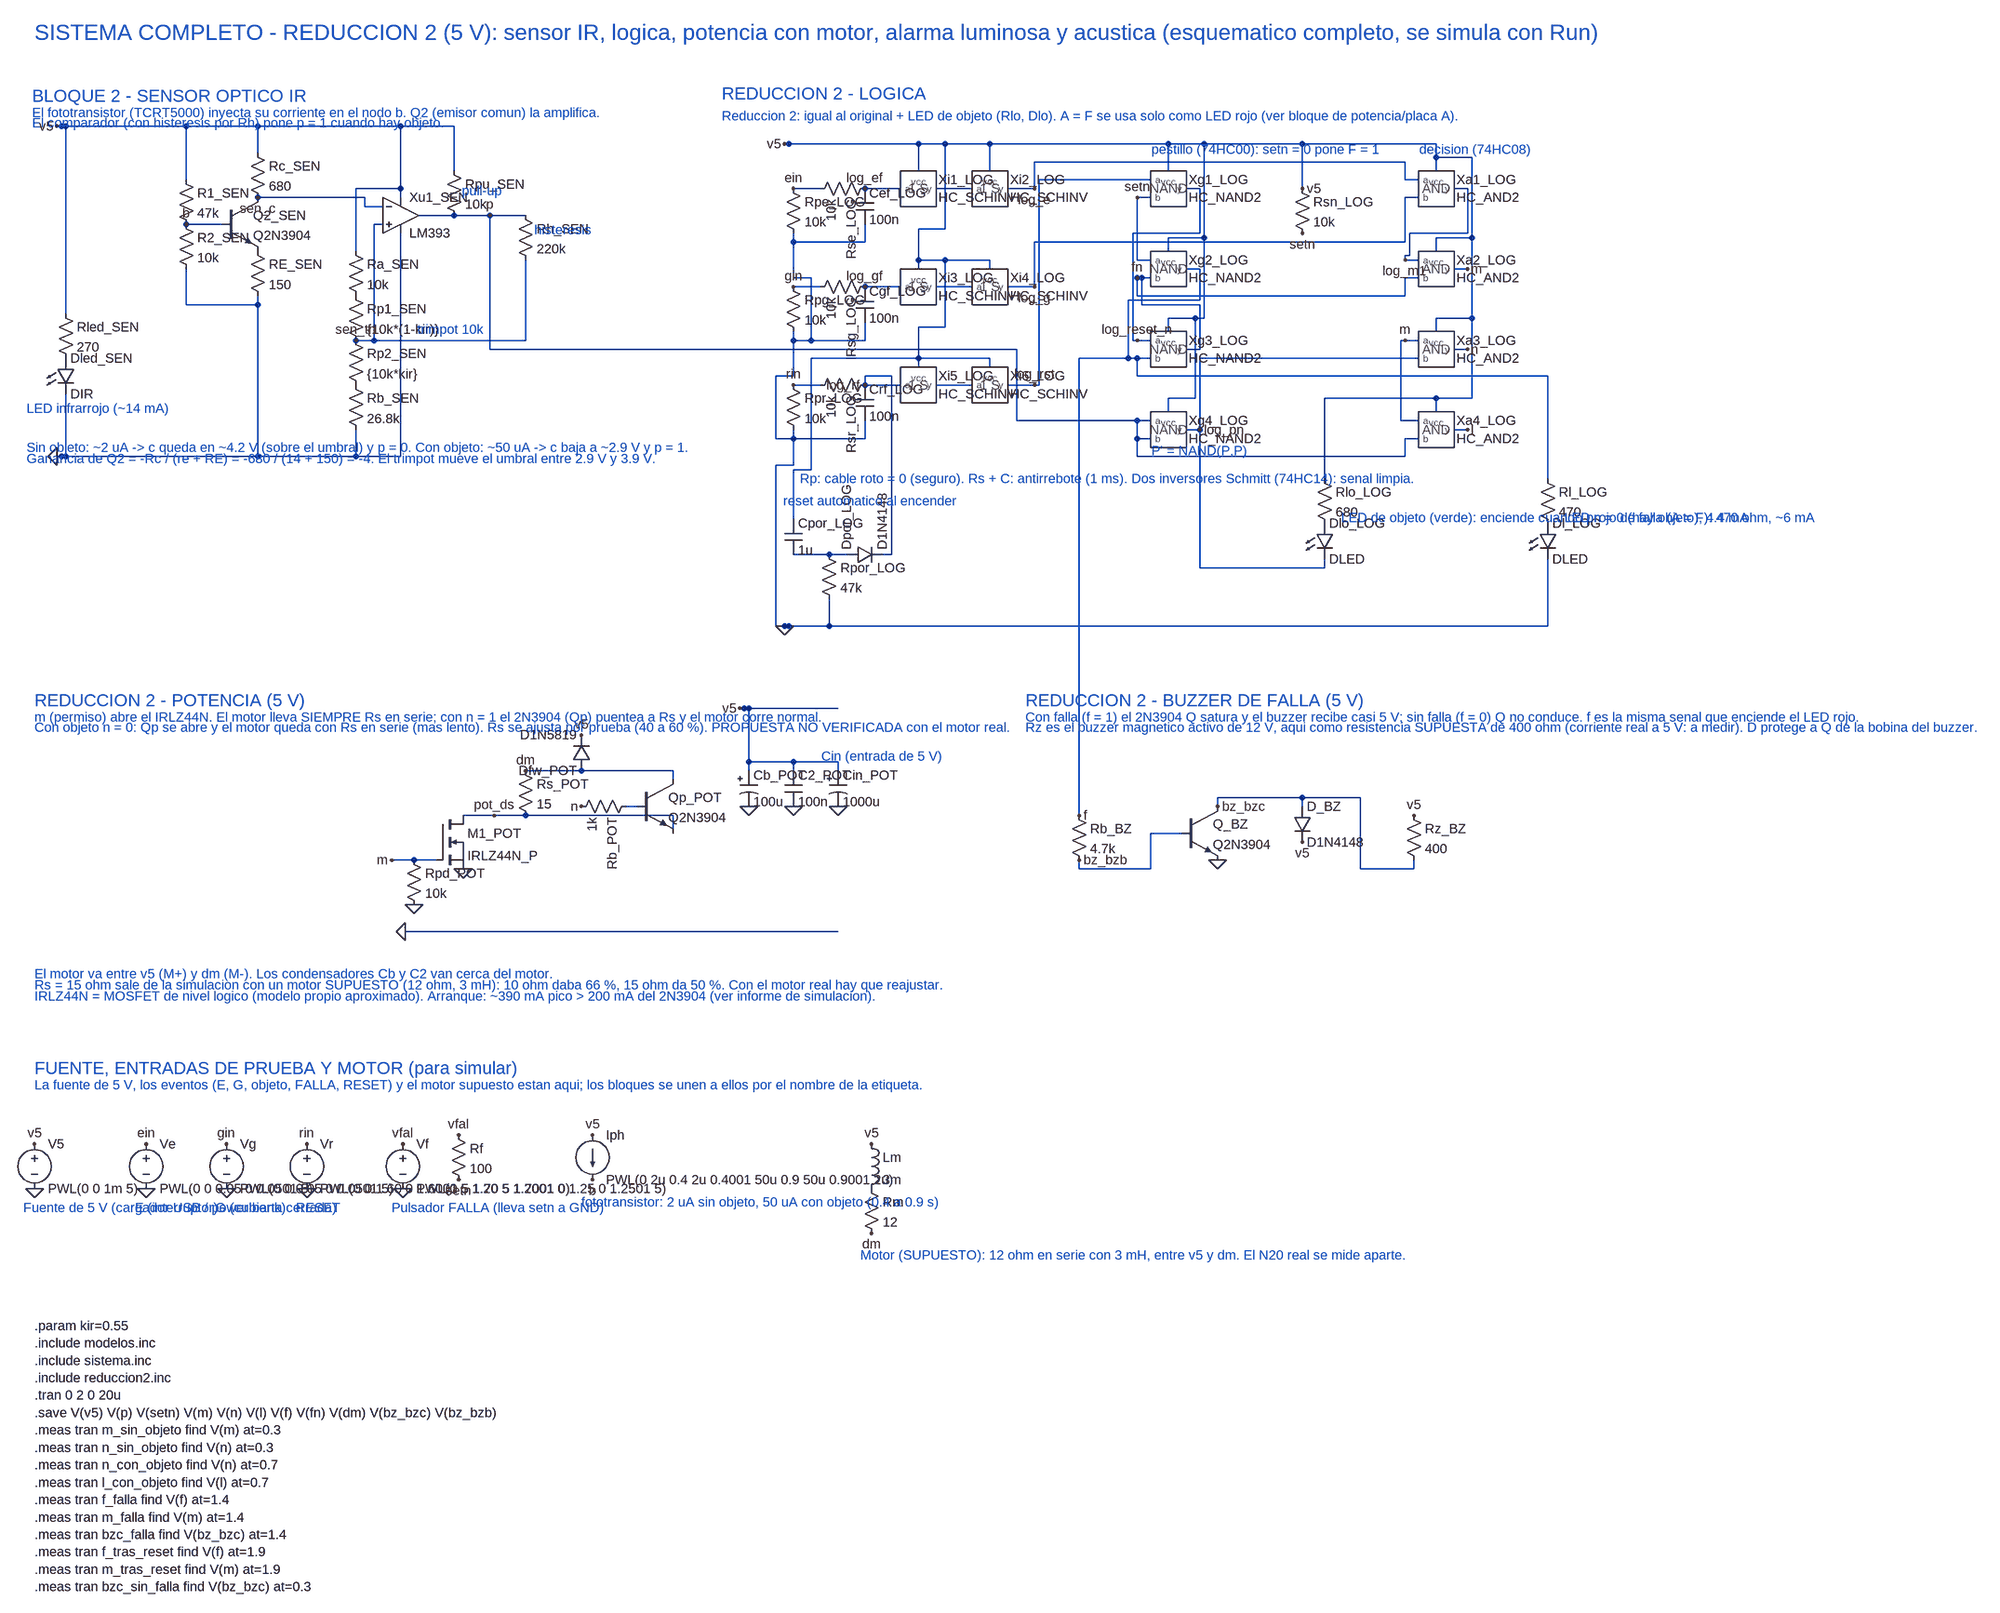
[diagram p0: schematic SISTEMA_COMPLETO_R2.asc]
SISTEMA_COMPLETO_R2.asc, the LTspice schematic file:
Version 4
SHEET 1 9000 2828
WIRE 272 224 336 224
WIRE 400 176 592 176
WIRE 592 176 592 192
WIRE 592 192 624 192
WIRE 576 432 608 432
WIRE 608 432 608 224
WIRE 608 224 624 224
WIRE 688 208 752 208
WIRE 752 208 816 208
WIRE 816 208 880 208
WIRE 880 288 880 432
WIRE 880 432 608 432
WIRE 40 48 752 48
WIRE 40 48 48 48
WIRE 400 96 400 48
WIRE 752 128 752 48
WIRE 272 144 272 48
WIRE 656 176 656 48
WIRE 576 272 576 160
WIRE 576 160 656 160
WIRE 56 384 56 48
WIRE 40 640 656 640
WIRE 40 640 48 640
WIRE 576 592 576 640
WIRE 56 528 56 640
WIRE 400 352 400 640
WIRE 272 304 272 368
WIRE 272 368 400 368
WIRE 656 240 656 640
WIRE 1360 160 1408 160
WIRE 1488 160 1552 160
WIRE 1616 160 1680 160
WIRE 1744 160 1792 160
WIRE 1360 336 1408 336
WIRE 1488 336 1552 336
WIRE 1616 336 1680 336
WIRE 1744 336 1792 336
WIRE 1360 512 1408 512
WIRE 1488 512 1552 512
WIRE 1616 512 1680 512
WIRE 1744 512 1792 512
WIRE 1360 816 1424 816
WIRE 1424 816 1456 816
WIRE 2064 160 2088 160
WIRE 2032 128 2032 104
WIRE 2000 144 1976 144
WIRE 2000 176 1976 176
WIRE 2064 304 2088 304
WIRE 2032 272 2032 248
WIRE 2000 288 1976 288
WIRE 2000 320 1976 320
WIRE 2064 448 2088 448
WIRE 2032 416 2032 392
WIRE 2000 432 1976 432
WIRE 2000 464 1976 464
WIRE 2064 592 2088 592
WIRE 2032 560 2032 536
WIRE 2000 576 1976 576
WIRE 2000 608 1976 608
WIRE 2544 160 2568 160
WIRE 2512 128 2512 104
WIRE 2480 144 2456 144
WIRE 2480 176 2456 176
WIRE 2544 304 2568 304
WIRE 2512 272 2512 248
WIRE 2480 288 2456 288
WIRE 2480 320 2456 320
WIRE 2544 448 2568 448
WIRE 2512 416 2512 392
WIRE 2480 432 2456 432
WIRE 2480 464 2456 464
WIRE 2544 592 2568 592
WIRE 2512 560 2512 536
WIRE 2480 576 2456 576
WIRE 2480 608 2456 608
WIRE 2456 144 2456 112
WIRE 2456 112 1792 112
WIRE 1792 112 1792 160
WIRE 2712 680 2712 496
WIRE 2712 496 1976 496
WIRE 1976 496 1976 464
WIRE 2456 320 2456 352
WIRE 2456 352 1976 352
WIRE 1976 352 1976 320
WIRE 2456 176 2456 256
WIRE 2456 256 1792 256
WIRE 1792 256 1792 336
WIRE 2456 576 2448 576
WIRE 2448 576 2448 432
WIRE 2448 432 2456 432
WIRE 2568 160 2568 240
WIRE 2568 240 2464 240
WIRE 2464 240 2464 280
WIRE 2464 280 2456 280
WIRE 2456 280 2456 288
WIRE 2456 608 2456 640
WIRE 2456 640 1976 640
WIRE 1976 640 1976 608
WIRE 2088 160 2088 240
WIRE 2088 240 1968 240
WIRE 1968 240 1968 432
WIRE 1968 432 1976 432
WIRE 1520 816 1536 816
WIRE 1536 816 1536 496
WIRE 1536 496 1488 496
WIRE 1488 496 1488 512
WIRE 1976 144 1800 144
WIRE 1800 144 1800 512
WIRE 1800 512 1792 512
WIRE 1976 288 1976 176
WIRE 2312 824 2312 840
WIRE 2312 840 2088 840
WIRE 2088 840 2088 592
WIRE 2456 464 2088 464
WIRE 2088 464 2088 592
WIRE 1344 80 2512 80
WIRE 1344 80 1352 80
WIRE 2032 104 2032 80
WIRE 2512 104 2512 80
WIRE 1584 128 1584 80
WIRE 1712 128 1712 80
WIRE 2272 160 2272 80
WIRE 2032 248 2096 248
WIRE 2096 248 2096 80
WIRE 2512 248 2576 248
WIRE 2576 248 2576 104
WIRE 2576 104 2512 104
WIRE 2032 392 2096 392
WIRE 2096 392 2096 248
WIRE 2512 392 2576 392
WIRE 2576 392 2576 248
WIRE 2032 536 2080 536
WIRE 2080 536 2080 392
WIRE 2512 536 2576 536
WIRE 2576 536 2576 392
WIRE 1584 304 1584 232
WIRE 1584 232 1632 232
WIRE 1632 232 1632 80
WIRE 1712 304 1712 288
WIRE 1712 288 1584 288
WIRE 1584 480 1584 408
WIRE 1584 408 1632 408
WIRE 1632 408 1632 288
WIRE 1712 480 1712 464
WIRE 1712 464 1584 464
WIRE 2312 680 2312 536
WIRE 2312 536 2512 536
WIRE 1360 752 1360 664
WIRE 1360 664 1392 664
WIRE 1392 664 1392 464
WIRE 1392 464 1584 464
WIRE 1344 944 2712 944
WIRE 1344 944 1352 944
WIRE 1424 896 1424 944
WIRE 2712 824 2712 944
WIRE 1360 592 1360 656
WIRE 1360 656 1328 656
WIRE 1328 656 1328 944
WIRE 1328 944 1344 944
WIRE 1488 576 1488 608
WIRE 1488 608 1360 608
WIRE 1360 416 1360 496
WIRE 1360 496 1328 496
WIRE 1328 496 1328 608
WIRE 1328 608 1360 608
WIRE 1488 400 1488 432
WIRE 1488 432 1360 432
WIRE 1360 240 1360 320
WIRE 1360 320 1392 320
WIRE 1392 320 1392 432
WIRE 1488 224 1488 256
WIRE 1488 256 1360 256
WIRE 720 1520 640 1520
WIRE 768 1440 880 1440
WIRE 880 1440 1144 1440
WIRE 880 1360 980 1360
WIRE 980 1360 1144 1360
WIRE 1144 1360 1144 1376
WIRE 1144 1472 1144 1440
WIRE 1060 1424 1080 1424
WIRE 1264 1248 1440 1248
WIRE 1264 1248 1272 1248
WIRE 1280 1360 1280 1248
WIRE 1360 1360 1360 1344
WIRE 1360 1344 1280 1344
WIRE 1440 1360 1440 1344
WIRE 1440 1344 1360 1344
WIRE 664 1648 1440 1648
WIRE 2056 1472 2000 1472
WIRE 2000 1472 2000 1536
WIRE 2000 1536 1872 1536
WIRE 1872 1536 1872 1520
WIRE 2088 448 2088 368
WIRE 2088 368 1984 368
WIRE 1984 368 1984 320
WIRE 1984 320 1976 320
WIRE 2272 1424 2272 1408
WIRE 2272 1408 2120 1408
WIRE 2120 1408 2120 1424
WIRE 2472 1520 2472 1536
WIRE 2472 1536 2376 1536
WIRE 2376 1536 2376 1408
WIRE 2376 1408 2272 1408
WIRE 1976 464 1872 464
WIRE 1872 464 1872 1440
WIRE 2088 304 2088 360
WIRE 2088 360 1960 360
WIRE 1960 360 1960 464
WIRE 1976 576 1760 576
WIRE 1760 576 1760 448
WIRE 1760 448 816 448
WIRE 816 448 816 208
WIRE 1976 608 1976 576
FLAG 272 224 b
FLAG 400 176 sen_c
FLAG 576 432 sen_th
FLAG 816 208 p
FLAG 40 48 v5
FLAG 40 640 0
FLAG 1360 160 ein
FLAG 1488 160 log_ef
FLAG 1792 160 log_e
FLAG 1360 336 gin
FLAG 1488 336 log_gf
FLAG 1792 336 log_g
FLAG 1360 512 rin
FLAG 1488 512 log_rf
FLAG 1792 512 log_rst
FLAG 1976 176 setn
FLAG 1976 320 fn
FLAG 1976 432 log_reset_n
FLAG 2088 592 log_pn
FLAG 2272 160 v5
FLAG 2272 240 setn
FLAG 2568 304 m
FLAG 2456 288 log_m1
FLAG 2568 448 n
FLAG 2456 432 m
FLAG 2568 592 l
FLAG 1344 80 v5
FLAG 1344 944 0
FLAG 640 1520 m
FLAG 680 1600 0
FLAG 768 1536 0
FLAG 824 1440 pot_ds
FLAG 880 1360 dm
FLAG 980 1296 v5
FLAG 980 1424 n
FLAG 1280 1424 0
FLAG 1440 1424 0
FLAG 1360 1424 0
FLAG 1264 1248 v5
FLAG 664 1648 0
FLAG 1872 1440 f
FLAG 1872 1520 bz_bzb
FLAG 2120 1424 bz_bzc
FLAG 2120 1520 0
FLAG 2272 1488 v5
FLAG 2472 1440 v5
FLAG 0 2144 v5
FLAG 0 2224 0
FLAG 200 2144 ein
FLAG 200 2224 0
FLAG 344 2144 gin
FLAG 344 2224 0
FLAG 488 2144 rin
FLAG 488 2224 0
FLAG 660 2144 vfal
FLAG 760 2128 vfal
FLAG 760 2208 setn
FLAG 660 2224 0
FLAG 1000 2128 v5
FLAG 1000 2208 b
FLAG 1500 2144 v5
FLAG 1500 2304 dm
SYMBOL res 40 368 R0
SYMATTR InstName Rled_SEN
SYMATTR Value 270
SYMBOL LED 40 464 R0
SYMATTR InstName Dled_SEN
SYMATTR Value DIR
SYMBOL res 256 128 R0
SYMATTR InstName R1_SEN
SYMATTR Value 47k
SYMBOL res 256 208 R0
SYMATTR InstName R2_SEN
SYMATTR Value 10k
SYMBOL npn 336 176 R0
SYMATTR InstName Q2_SEN
SYMATTR Value Q2N3904
SYMBOL res 384 80 R0
SYMATTR InstName Rc_SEN
SYMATTR Value 680
SYMBOL res 384 256 R0
SYMATTR InstName RE_SEN
SYMATTR Value 150
SYMBOL res 560 256 R0
SYMATTR InstName Ra_SEN
SYMATTR Value 10k
SYMBOL res 560 336 R0
SYMATTR InstName Rp1_SEN
SYMATTR Value {10k*(1-kir)}
SYMBOL res 560 416 R0
SYMATTR InstName Rp2_SEN
SYMATTR Value {10k*kir}
SYMBOL res 560 496 R0
SYMATTR InstName Rb_SEN
SYMATTR Value 26.8k
SYMBOL OpAmps\opamp2 656 144 R0
SYMATTR InstName Xu1_SEN
SYMATTR Value LM393
SYMBOL res 736 112 R0
SYMATTR InstName Rpu_SEN
SYMATTR Value 10k
SYMBOL res 864 192 R0
SYMATTR InstName Rh_SEN
SYMATTR Value 220k
SYMBOL res 1344 144 R0
SYMATTR InstName Rpe_LOG
SYMATTR Value 10k
SYMBOL res 1504 144 R90
SYMATTR InstName Rse_LOG
SYMATTR Value 10k
SYMBOL cap 1472 160 R0
SYMATTR InstName Cef_LOG
SYMATTR Value 100n
SYMBOL HC_SCHINV 1584 160 R0
SYMATTR InstName Xi1_LOG
SYMATTR Value HC_SCHINV
SYMBOL HC_SCHINV 1712 160 R0
SYMATTR InstName Xi2_LOG
SYMATTR Value HC_SCHINV
SYMBOL res 1344 320 R0
SYMATTR InstName Rpg_LOG
SYMATTR Value 10k
SYMBOL res 1504 320 R90
SYMATTR InstName Rsg_LOG
SYMATTR Value 10k
SYMBOL cap 1472 336 R0
SYMATTR InstName Cgf_LOG
SYMATTR Value 100n
SYMBOL HC_SCHINV 1584 336 R0
SYMATTR InstName Xi3_LOG
SYMATTR Value HC_SCHINV
SYMBOL HC_SCHINV 1712 336 R0
SYMATTR InstName Xi4_LOG
SYMATTR Value HC_SCHINV
SYMBOL res 1344 496 R0
SYMATTR InstName Rpr_LOG
SYMATTR Value 10k
SYMBOL res 1504 496 R90
SYMATTR InstName Rsr_LOG
SYMATTR Value 10k
SYMBOL cap 1472 512 R0
SYMATTR InstName Crf_LOG
SYMATTR Value 100n
SYMBOL HC_SCHINV 1584 512 R0
SYMATTR InstName Xi5_LOG
SYMATTR Value HC_SCHINV
SYMBOL HC_SCHINV 1712 512 R0
SYMATTR InstName Xi6_LOG
SYMATTR Value HC_SCHINV
SYMBOL cap 1344 752 R0
SYMATTR InstName Cpor_LOG
SYMATTR Value 1u
SYMBOL res 1408 800 R0
SYMATTR InstName Rpor_LOG
SYMATTR Value 47k
SYMBOL diode 1456 832 R270
SYMATTR InstName Dpor_LOG
SYMATTR Value D1N4148
SYMBOL HC_NAND2 2032 160 R0
SYMATTR InstName Xg1_LOG
SYMATTR Value HC_NAND2
SYMBOL HC_NAND2 2032 304 R0
SYMATTR InstName Xg2_LOG
SYMATTR Value HC_NAND2
SYMBOL HC_NAND2 2032 448 R0
SYMATTR InstName Xg3_LOG
SYMATTR Value HC_NAND2
SYMBOL HC_NAND2 2032 592 R0
SYMATTR InstName Xg4_LOG
SYMATTR Value HC_NAND2
SYMBOL res 2256 144 R0
SYMATTR InstName Rsn_LOG
SYMATTR Value 10k
SYMBOL HC_AND2 2512 160 R0
SYMATTR InstName Xa1_LOG
SYMATTR Value HC_AND2
SYMBOL HC_AND2 2512 304 R0
SYMATTR InstName Xa2_LOG
SYMATTR Value HC_AND2
SYMBOL HC_AND2 2512 448 R0
SYMATTR InstName Xa3_LOG
SYMATTR Value HC_AND2
SYMBOL HC_AND2 2512 592 R0
SYMATTR InstName Xa4_LOG
SYMATTR Value HC_AND2
SYMBOL res 2296 664 R0
SYMATTR InstName Rlo_LOG
SYMATTR Value 680
SYMBOL LED 2296 760 R0
SYMATTR InstName Dlo_LOG
SYMATTR Value DLED
SYMBOL res 2696 664 R0
SYMATTR InstName Rl_LOG
SYMATTR Value 470
SYMBOL LED 2696 760 R0
SYMATTR InstName Dl_LOG
SYMATTR Value DLED
SYMBOL res 664 1504 R0
SYMATTR InstName Rpd_POT
SYMATTR Value 10k
SYMBOL nmos 720 1440 R0
SYMATTR InstName M1_POT
SYMATTR Value IRLZ44N_P
SYMBOL res 864 1344 R0
SYMATTR InstName Rs_POT
SYMATTR Value 15
SYMBOL diode 996 1360 R180
SYMATTR InstName Dfw_POT
SYMATTR Value D1N5819
SYMBOL npn 1080 1376 R0
SYMATTR InstName Qp_POT
SYMATTR Value Q2N3904
SYMBOL res 1076 1408 R90
SYMATTR InstName Rb_POT
SYMATTR Value 1k
SYMBOL polcap 1264 1360 R0
SYMATTR InstName Cb_POT
SYMATTR Value 100u
SYMBOL polcap 1424 1360 R0
SYMATTR InstName Cin_POT
SYMATTR Value 1000u
SYMBOL cap 1344 1360 R0
SYMATTR InstName C2_POT
SYMATTR Value 100n
SYMBOL res 1856 1424 R0
SYMATTR InstName Rb_BZ
SYMATTR Value 4.7k
SYMBOL npn 2056 1424 R0
SYMATTR InstName Q_BZ
SYMATTR Value Q2N3904
SYMBOL diode 2256 1424 R0
SYMATTR InstName D_BZ
SYMATTR Value D1N4148
SYMBOL res 2456 1424 R0
SYMATTR InstName Rz_BZ
SYMATTR Value 400
SYMBOL voltage 0 2128 R0
SYMATTR InstName V5
SYMATTR Value PWL(0 0 1m 5)
SYMBOL voltage 200 2128 R0
SYMATTR InstName Ve
SYMATTR Value PWL(0 0 0.05 0 0.0501 5)
SYMBOL voltage 344 2128 R0
SYMATTR InstName Vg
SYMATTR Value PWL(0 0 0.05 0 0.0501 5)
SYMBOL voltage 488 2128 R0
SYMATTR InstName Vr
SYMATTR Value PWL(0 0 1.60 0 1.6001 5 1.70 5 1.7001 0)
SYMBOL voltage 660 2128 R0
SYMATTR InstName Vf
SYMATTR Value PWL(0 5 1.20 5 1.2001 0 1.25 0 1.2501 5)
SYMBOL res 744 2112 R0
SYMATTR InstName Rf
SYMATTR Value 100
SYMBOL current 1000 2128 R0
SYMATTR InstName Iph
SYMATTR Value PWL(0 2u 0.4 2u 0.4001 50u 0.9 50u 0.9001 2u)
SYMBOL ind 1484 2128 R0
SYMATTR InstName Lm
SYMATTR Value 3m
SYMBOL res 1484 2208 R0
SYMATTR InstName Rm
SYMATTR Value 12
TEXT -4 -6 Left 3 ;BLOQUE 2 - SENSOR OPTICO IR
TEXT -4 24 Left 2 ;El fototransistor (TCRT5000) inyecta su corriente en el nodo b. Q2 (emisor comun) la amplifica.
TEXT -4 42 Left 2 ;El comparador (con histeresis por Rh) pone p = 1 cuando hay objeto.
TEXT -14 554 Left 2 ;LED infrarrojo (~14 mA)
TEXT 686 412 Left 2 ;trimpot 10k
TEXT 896 234 Left 2 ;histeresis
TEXT 766 164 Left 2 ;pull-up
TEXT -14 624 Left 2 ;Sin objeto: ~2 uA -> c queda en ~4.2 V (sobre el umbral) y p = 0. Con objeto: ~50 uA -> c baja a ~2.9 V y p = 1.
TEXT -14 644 Left 2 ;Ganancia de Q2 = -Rc / (re + RE) = -680 / (14 + 150) = -4. El trimpot mueve el umbral entre 2.9 V y 3.9 V.
TEXT 1372 680 Left 2 ;Rp: cable roto = 0 (seguro). Rs + C: antirrebote (1 ms). Dos inversores Schmitt (74HC14): senal limpia.
TEXT 1342 720 Left 2 ;reset automatico al encender
TEXT 2002 90 Left 2 ;pestillo (74HC00): setn = 0 pone F = 1
TEXT 2002 630 Left 2 ;P' = NAND(P,P)
TEXT 2482 90 Left 2 ;decision (74HC08)
TEXT 2742 750 Left 2 ;LED rojo de falla (A = F): 470 ohm, ~6 mA
TEXT 2342 750 Left 2 ;LED de objeto (verde): enciende cuando pn = 0 (hay objeto), 4.4 mA
TEXT 1232 -10 Left 3 ;REDUCCION 2 - LOGICA
TEXT 1232 30 Left 2 ;Reduccion 2: igual al original + LED de objeto (Rlo, Dlo). A = F se usa solo como LED rojo (ver bloque de potencia/placa A).
TEXT 0 1234 Left 3 ;REDUCCION 2 - POTENCIA (5 V)
TEXT 0 1264 Left 2 ;m (permiso) abre el IRLZ44N. El motor lleva SIEMPRE Rs en serie; con n = 1 el 2N3904 (Qp) puentea a Rs y el motor corre normal.
TEXT 0 1282 Left 2 ;Con objeto n = 0: Qp se abre y el motor queda con Rs en serie (mas lento). Rs se ajusta por prueba (40 a 60 %). PROPUESTA NO VERIFICADA con el motor real.
TEXT 1410 1334 Left 2 ;Cin (entrada de 5 V)
TEXT 0 1724 Left 2 ;El motor va entre v5 (M+) y dm (M-). Los condensadores Cb y C2 van cerca del motor.
TEXT 0 1744 Left 2 ;Rs = 15 ohm sale de la simulacion con un motor SUPUESTO (12 ohm, 3 mH): 10 ohm daba 66 %, 15 ohm da 50 %. Con el motor real hay que reajustar.
TEXT 0 1764 Left 2 ;IRLZ44N = MOSFET de nivel logico (modelo propio aproximado). Arranque: ~390 mA pico > 200 mA del 2N3904 (ver informe de simulacion).
TEXT 1776 1234 Left 3 ;REDUCCION 2 - BUZZER DE FALLA (5 V)
TEXT 1776 1264 Left 2 ;Con falla (f = 1) el 2N3904 Q satura y el buzzer recibe casi 5 V; sin falla (f = 0) Q no conduce. f es la misma senal que enciende el LED rojo.
TEXT 1776 1282 Left 2 ;Rz es el buzzer magnetico activo de 12 V, aqui como resistencia SUPUESTA de 400 ohm (corriente real a 5 V: a medir). D protege a Q de la bobina del buzzer.
TEXT 0 2008 Left 3 ;FUENTE, ENTRADAS DE PRUEBA Y MOTOR (para simular)
TEXT 0 2038 Left 2 ;La fuente de 5 V, los eventos (E, G, objeto, FALLA, RESET) y el motor supuesto estan aqui; los bloques se unen a ellos por el nombre de la etiqueta.
TEXT -20 2258 Left 2 ;Fuente de 5 V (cargador USB / power bank)
TEXT 180 2258 Left 2 ;E (interruptor)
TEXT 324 2258 Left 2 ;G (cubierta cerrada)
TEXT 468 2258 Left 2 ;RESET
TEXT 640 2258 Left 2 ;Pulsador FALLA (lleva setn a GND)
TEXT 980 2248 Left 2 ;fototransistor: 2 uA sin objeto, 50 uA con objeto (0.4 a 0.9 s)
TEXT 1480 2343 Left 2 ;Motor (SUPUESTO): 12 ohm en serie con 3 mH, entre v5 y dm. El N20 real se mide aparte.
TEXT 0 -120 Left 4 ;SISTEMA COMPLETO - REDUCCION 2 (5 V): sensor IR, logica, potencia con motor, alarma luminosa y acustica (esquematico completo, se simula con Run)
TEXT 0 2528 Left 2 !.param kir=0.55\n.include modelos.inc\n.include sistema.inc\n.include reduccion2.inc\n.tran 0 2 0 20u\n.save V(v5) V(p) V(setn) V(m) V(n) V(l) V(f) V(fn) V(dm) V(bz_bzc) V(bz_bzb)\n.meas tran m_sin_objeto find V(m) at=0.3\n.meas tran n_sin_objeto find V(n) at=0.3\n.meas tran n_con_objeto find V(n) at=0.7\n.meas tran l_con_objeto find V(l) at=0.7\n.meas tran f_falla find V(f) at=1.4\n.meas tran m_falla find V(m) at=1.4\n.meas tran bzc_falla find V(bz_bzc) at=1.4\n.meas tran f_tras_reset find V(f) at=1.9\n.meas tran m_tras_reset find V(m) at=1.9\n.meas tran bzc_sin_falla find V(bz_bzc) at=0.3

The netlist it stands for:
* SISTEMA_COMPLETO_R2.asc
Rled_SEN v5 P001 270
Dled_SEN P001 0 DIR
R1_SEN v5 b 47k
R2_SEN b 0 10k
Q2_SEN sen_c b P002 0 Q2N3904
Rc_SEN v5 sen_c 680
RE_SEN P002 0 150
Ra_SEN v5 P003 10k
Rp1_SEN P003 sen_th {10k*(1-kir)}
Rp2_SEN sen_th P004 {10k*kir}
Rb_SEN P004 0 26.8k
XXu1_SEN sen_th sen_c v5 0 p LM393  ; pins In+ In- V+ V- OUT
Rpu_SEN v5 p 10k
Rh_SEN p sen_th 220k
Rpe_LOG ein 0 10k
Rse_LOG log_ef ein 10k
Cef_LOG log_ef 0 100n
XXi1_LOG log_ef N001 v5 HC_SCHINV  ; pins a y vcc
XXi2_LOG N001 log_e v5 HC_SCHINV  ; pins a y vcc
Rpg_LOG gin 0 10k
Rsg_LOG log_gf gin 10k
Cgf_LOG log_gf 0 100n
XXi3_LOG log_gf N002 v5 HC_SCHINV  ; pins a y vcc
XXi4_LOG N002 log_g v5 HC_SCHINV  ; pins a y vcc
Rpr_LOG rin 0 10k
Rsr_LOG log_rf rin 10k
Crf_LOG log_rf 0 100n
XXi5_LOG log_rf N003 v5 HC_SCHINV  ; pins a y vcc
XXi6_LOG N003 log_rst v5 HC_SCHINV  ; pins a y vcc
Cpor_LOG v5 N004 1u
Rpor_LOG N004 0 47k
Dpor_LOG N004 log_rf D1N4148
XXg1_LOG log_rst setn log_reset_n v5 HC_NAND2  ; pins a b y vcc
XXg2_LOG setn fn f v5 HC_NAND2  ; pins a b y vcc
XXg3_LOG log_reset_n f fn v5 HC_NAND2  ; pins a b y vcc
XXg4_LOG p p log_pn v5 HC_NAND2  ; pins a b y vcc
Rsn_LOG v5 setn 10k
XXa1_LOG log_e log_g log_m1 v5 HC_AND2  ; pins a b y vcc
XXa2_LOG log_m1 fn m v5 HC_AND2  ; pins a b y vcc
XXa3_LOG m log_pn n v5 HC_AND2  ; pins a b y vcc
XXa4_LOG m p l v5 HC_AND2  ; pins a b y vcc
Rlo_LOG v5 P005 680
Dlo_LOG P005 log_pn DLED
Rl_LOG f P006 470
Dl_LOG P006 0 DLED
Rpd_POT m 0 10k
M1_POT pot_ds m 0 0 IRLZ44N_P
Rs_POT dm pot_ds 15
Dfw_POT dm v5 D1N5819
Qp_POT dm N005 pot_ds 0 Q2N3904
Rb_POT N005 n 1k
Cb_POT v5 0 100u
Cin_POT v5 0 1000u
C2_POT v5 0 100n
Rb_BZ f bz_bzb 4.7k
Q_BZ bz_bzc bz_bzb 0 0 Q2N3904
D_BZ bz_bzc v5 D1N4148
Rz_BZ v5 bz_bzc 400
V5 v5 0 PWL(0 0 1m 5)
Ve ein 0 PWL(0 0 0.05 0 0.0501 5)
Vg gin 0 PWL(0 0 0.05 0 0.0501 5)
Vr rin 0 PWL(0 0 1.60 0 1.6001 5 1.70 5 1.7001 0)
Vf vfal 0 PWL(0 5 1.20 5 1.2001 0 1.25 0 1.2501 5)
Rf vfal setn 100
Iph v5 b PWL(0 2u 0.4 2u 0.4001 50u 0.9 50u 0.9001 2u)
Lm v5 P007 3m
Rm P007 dm 12
.model D D
.lib standard.dio
.model NPN NPN
.model PNP PNP
.lib standard.bjt
.model NMOS NMOS
.model PMOS PMOS
.lib standard.mos
* BLOQUE 2 - SENSOR OPTICO IR
* El fototransistor (TCRT5000) inyecta su corriente en el nodo b. Q2 (emisor comun) la amplifica.
* El comparador (con histeresis por Rh) pone p = 1 cuando hay objeto.
* LED infrarrojo (~14 mA)
* trimpot 10k
* histeresis
* pull-up
* Sin objeto: ~2 uA -> c queda en ~4.2 V (sobre el umbral) y p = 0. Con objeto: ~50 uA -> c baja a ~2.9 V y p = 1.
* Ganancia de Q2 = -Rc / (re + RE) = -680 / (14 + 150) = -4. El trimpot mueve el umbral entre 2.9 V y 3.9 V.
* Rp: cable roto = 0 (seguro). Rs + C: antirrebote (1 ms). Dos inversores Schmitt (74HC14): senal limpia.
* reset automatico al encender
* pestillo (74HC00): setn = 0 pone F = 1
* P' = NAND(P,P)
* decision (74HC08)
* LED rojo de falla (A = F): 470 ohm, ~6 mA
* LED de objeto (verde): enciende cuando pn = 0 (hay objeto), 4.4 mA
* REDUCCION 2 - LOGICA
* Reduccion 2: igual al original + LED de objeto (Rlo, Dlo). A = F se usa solo como LED rojo (ver bloque de potencia/placa A).
* REDUCCION 2 - POTENCIA (5 V)
* m (permiso) abre el IRLZ44N. El motor lleva SIEMPRE Rs en serie; con n = 1 el 2N3904 (Qp) puentea a Rs y el motor corre normal.
* Con objeto n = 0: Qp se abre y el motor queda con Rs en serie (mas lento). Rs se ajusta por prueba (40 a 60 %). PROPUESTA NO VERIFICADA con el motor real.
* Cin (entrada de 5 V)
* El motor va entre v5 (M+) y dm (M-). Los condensadores Cb y C2 van cerca del motor.
* Rs = 15 ohm sale de la simulacion con un motor SUPUESTO (12 ohm, 3 mH): 10 ohm daba 66 %, 15 ohm da 50 %. Con el motor real hay que reajustar.
* IRLZ44N = MOSFET de nivel logico (modelo propio aproximado). Arranque: ~390 mA pico > 200 mA del 2N3904 (ver informe de simulacion).
* REDUCCION 2 - BUZZER DE FALLA (5 V)
* Con falla (f = 1) el 2N3904 Q satura y el buzzer recibe casi 5 V; sin falla (f = 0) Q no conduce. f es la misma senal que enciende el LED rojo.
* Rz es el buzzer magnetico activo de 12 V, aqui como resistencia SUPUESTA de 400 ohm (corriente real a 5 V: a medir). D protege a Q de la bobina del buzzer.
* FUENTE, ENTRADAS DE PRUEBA Y MOTOR (para simular)
* La fuente de 5 V, los eventos (E, G, objeto, FALLA, RESET) y el motor supuesto estan aqui; los bloques se unen a ellos por el nombre de la etiqueta.
* Fuente de 5 V (cargador USB / power bank)
* E (interruptor)
* G (cubierta cerrada)
* RESET
* Pulsador FALLA (lleva setn a GND)
* fototransistor: 2 uA sin objeto, 50 uA con objeto (0.4 a 0.9 s)
* Motor (SUPUESTO): 12 ohm en serie con 3 mH, entre v5 y dm. El N20 real se mide aparte.
* SISTEMA COMPLETO - REDUCCION 2 (5 V): sensor IR, logica, potencia con motor, alarma luminosa y acustica (esquematico completo, se simula con Run)
.param kir=0.55
.include modelos.inc
.include sistema.inc
.include reduccion2.inc
.tran 0 2 0 20u
.save V(v5) V(p) V(setn) V(m) V(n) V(l) V(f) V(fn) V(dm) V(bz_bzc) V(bz_bzb)
.meas tran m_sin_objeto find V(m) at=0.3
.meas tran n_sin_objeto find V(n) at=0.3
.meas tran n_con_objeto find V(n) at=0.7
.meas tran l_con_objeto find V(l) at=0.7
.meas tran f_falla find V(f) at=1.4
.meas tran m_falla find V(m) at=1.4
.meas tran bzc_falla find V(bz_bzc) at=1.4
.meas tran f_tras_reset find V(f) at=1.9
.meas tran m_tras_reset find V(m) at=1.9
.meas tran bzc_sin_falla find V(bz_bzc) at=0.3
.backanno
.end